# Altium schematic sheet ProjectSchematic.remote-reference.SchDoc
size A
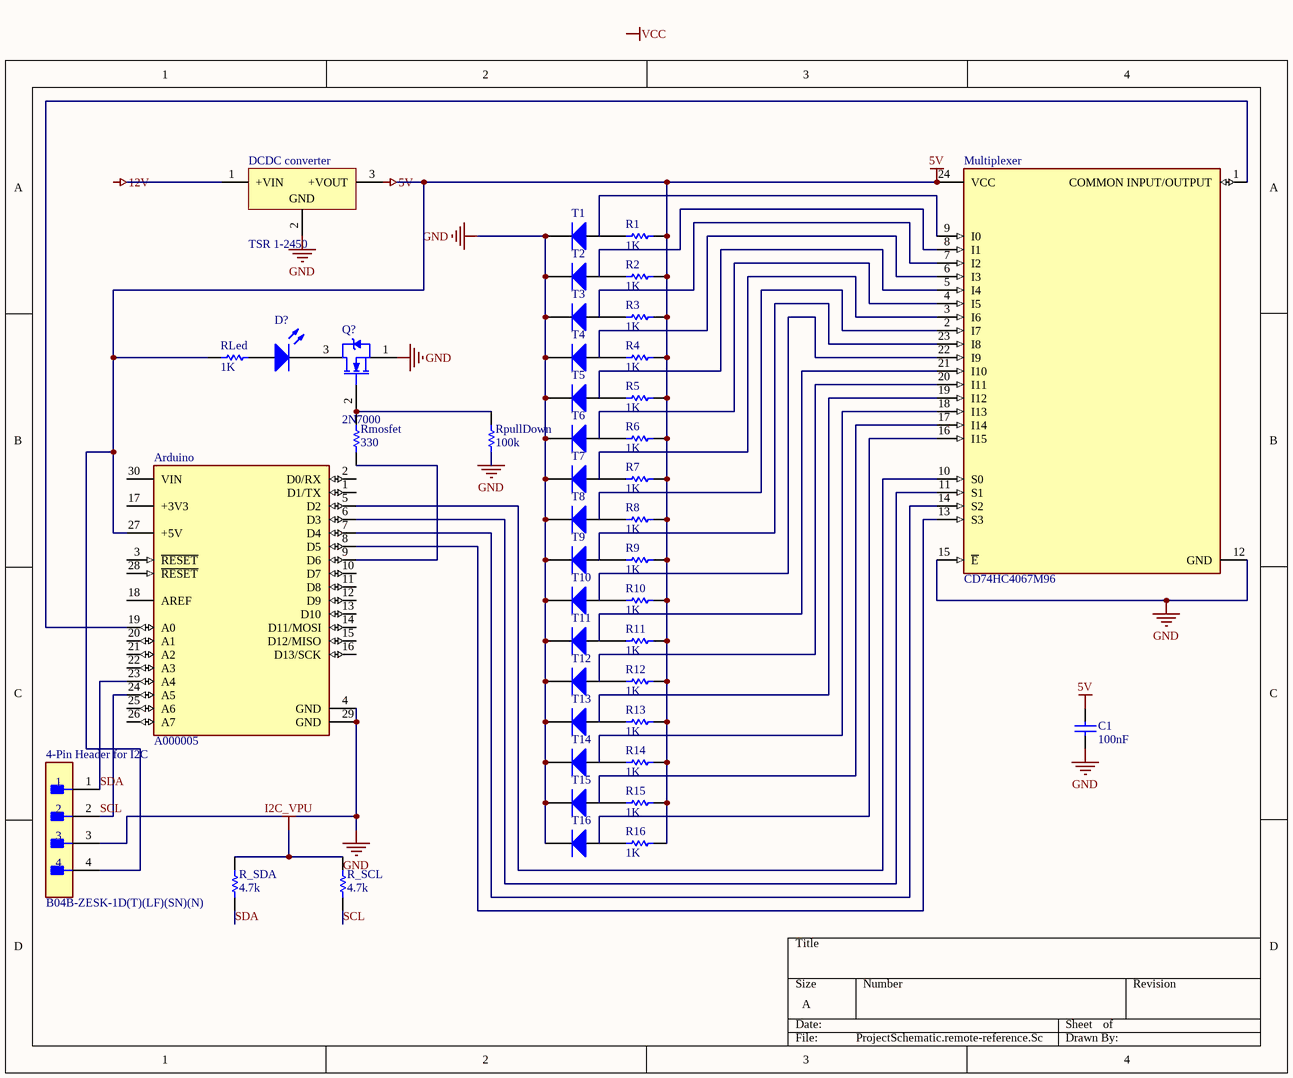
[diagram p0: ProjectSchematic.remote-reference.SchDoc]

## Parts
4-Pin_Header_for_I2C  B04B-ZESK-1D(T)(LF)(SN)(N)  [FP-B04B-ZESK-1D_T_LF_SN-MFG]
Arduino  A000005  [FP-A000005-MFG]
C1  value 100nF  (hidden comment: Capacitor)
D?  Light-Emitting Diode  (value not drawn)
DCDC_converter  TSR 1-2450  [TRACO-SIP-3_V]
Multiplexer  CD74HC4067M96  [FP-DW0024A-MFG]
Q?  2N7000  [ONSC-TO-92-3-29-11]
R1  value 1K  (hidden comment: Resistor)
R2  value 1K  (hidden comment: Resistor)
R3  value 1K  (hidden comment: Resistor)
R4  value 1K  (hidden comment: Resistor)
R5  value 1K  (hidden comment: Resistor)
R6  value 1K  (hidden comment: Resistor)
R7  value 1K  (hidden comment: Resistor)
R8  value 1K  (hidden comment: Resistor)
R9  value 1K  (hidden comment: Resistor)
R10  value 1K  (hidden comment: Resistor)
R11  value 1K  (hidden comment: Resistor)
R12  value 1K  (hidden comment: Resistor)
R13  value 1K  (hidden comment: Resistor)
R14  value 1K  (hidden comment: Resistor)
R15  value 1K  (hidden comment: Resistor)
R16  value 1K  (hidden comment: Resistor)
R_SCL  value 4.7k  (hidden comment: Resistor)
R_SDA  value 4.7k  (hidden comment: Resistor)
RLed  value 1K  (hidden comment: Resistor)
Rmosfet  value 330  (hidden comment: Resistor)
RpullDown  value 100k  (hidden comment: Resistor)
T1  Diode  (value not drawn)
T2  Diode  (value not drawn)
T3  Diode  (value not drawn)
T4  Diode  (value not drawn)
T5  Diode  (value not drawn)
T6  Diode  (value not drawn)
T7  Diode  (value not drawn)
T8  Diode  (value not drawn)
T9  Diode  (value not drawn)
T10  Diode  (value not drawn)
T11  Diode  (value not drawn)
T12  Diode  (value not drawn)
T13  Diode  (value not drawn)
T14  Diode  (value not drawn)
T15  Diode  (value not drawn)
T16  Diode  (value not drawn)

## Nets
5V: 4-Pin_Header_for_I2C.4 Arduino.27(+5V) C1.2 DCDC_converter.3(+VOUT) Multiplexer.24(VCC) R1.2 R2.2 R3.2 R4.2 R5.2 R6.2 R7.2 R8.2 R9.2 R10.2 R11.2 R12.2 R13.2 R14.2 R15.2 R16.2 RLed.1
GND: 4-Pin_Header_for_I2C.3 Arduino.4(GND) Arduino.29(GND) C1.1 DCDC_converter.2(GND) Multiplexer.12(GND) Multiplexer.15(~{E}) Q?.1(S) RpullDown.1 T1.2(K) T2.2(K) T3.2(K) T4.2(K) T5.2(K) T6.2(K) T7.2(K) T8.2(K) T9.2(K) T10.2(K) T11.2(K) T12.2(K) T13.2(K) T14.2(K) T15.2(K) T16.2(K)
I2C_VPU: R_SCL.2 R_SDA.2
SCL: 4-Pin_Header_for_I2C.2 Arduino.24(A5) R_SCL.1
SDA: 4-Pin_Header_for_I2C.1 Arduino.23(A4) R_SDA.1
NetArduino_5: Arduino.5(D2) Multiplexer.10(S0)
NetArduino_6: Arduino.6(D3) Multiplexer.11(S1)
NetArduino_7: Arduino.7(D4) Multiplexer.14(S2)
NetArduino_8: Arduino.8(D5) Multiplexer.13(S3)
NetArduino_9: Arduino.9(D6) Rmosfet.1
NetArduino_19: Arduino.19(A0) Multiplexer.1(COMMON_INPUT/OUTPUT)
NetD?_2: D?.2(K) Q?.3(D)
NetQ?_2: Q?.2(G) Rmosfet.2 RpullDown.2
NetR1_1: R1.1 T1.1(A)
NetR2_1: R2.1 T2.1(A)
NetR3_1: R3.1 T3.1(A)
NetR4_1: R4.1 T4.1(A)
NetR5_1: R5.1 T5.1(A)
NetR6_1: R6.1 T6.1(A)
NetR7_1: R7.1 T7.1(A)
NetR8_1: R8.1 T8.1(A)
NetR9_1: R9.1 T9.1(A)
NetR10_1: R10.1 T10.1(A)
NetR11_1: R11.1 T11.1(A)
NetR12_1: R12.1 T12.1(A)
NetR13_1: R13.1 T13.1(A)
NetR14_1: R14.1 T14.1(A)
NetR15_1: R15.1 T15.1(A)
NetR16_1: R16.1 T16.1(A)

Not connected (* = marked no-connect by the designer): Arduino 1(D1/TX) 2(D0/RX) 3(~{RESET}) 10(D7) 11(D8) 12(D9) 13(D10) 14(D11/MOSI) 15(D12/MISO) 16(D13/SCK) 17(+3V3) 18(AREF) 20(A1) 21(A2) 22(A3) 25(A6) 26(A7) 28(~{RESET}) 30(VIN); D? 1(A); DCDC_converter 1(+VIN); Multiplexer 2(I7) 3(I6) 4(I5) 5(I4) 6(I3) 7(I2) 8(I1) 9(I0) 16(I15) 17(I14) 18(I13) 19(I12) 20(I11) 21(I10) 22(I9) 23(I8); RLed 2

## Notes on the sheet
- Labels drawn without touching a wire or pin: 12V, VCC

## Library data of the parts
4-Pin_Header_for_I2C = CMP-17439-000625-1: CONN HEADER VERT 4POS 1.5MM; Pitch: 0.059inch; Number of Positions: 4; Gender: Male; Voltage Rating: 100V; Connector Type: Header; Packaging: Tray; Insulation Color: Natural; Min Operating Temperature: -25°C; Package Quantity: 1664; Contact Material: Copper Alloy; Contact Finish - Mating: TIN; Flammability Rating: UL94 V-0; Contact Shape: Rectangular; Termination: Kinked Pin; Number of Rows: 1; Insulation Material: Nylon; Contact Type: Outer Shroud Contact; Mount: Through Hole; Color: Natural; Series: ZE; Contact Plating: Tin; Number of Contacts: 4; Fastening Type: Ramp; Max Operating Temperature: 85°C
Arduino = CMP-189986-000002-1: ARDUINO NANO ATMEGA328 EVAL BRD; Number of Bits: 8; Evaluation Kit: Yes; Operating Supply Voltage: 12V; Interface: I2C; Data Bus Width: 8b; Core Architecture: AVR; Packaging: Bulk; Length: 7inch; Package Quantity: 50; Width: 5inch; REACH SVHC: No SVHC; Weight: 0.358383oz; Series: AVR® ATmega; Height: 0.25inch
C1 = Capacitor: SimulationGenericComponent: True
D? = LED: AF: 1; BV: 0; BV_MAX: 1e99; EG: 1.11; FC: 0.5; IBV: 0.001; IS: 1e-14; MJSW: 0.33; NTUN: 30; TNOM: 27; XTI: 3; SimulationGenericComponent: True; CJO: 0; CJP: 0; CTA: 0; CTP: 0; FCS: 0.5; FV_MAX: 1e99; IKF: 0; IKR: 0; ISR: 1e-14; JSW: 0; JTUN: 0; JTUNSW: 0; KEG: 1; KF: 0; LEVEL: 1; N: 1; NBV: 1; NR: 1; NS: 1; PHP: 1; RS: 0; TCV: 0; TLEV: 0; TLEVC: 0; TM1: 0; TM2: 0; TPB: 0; TPHP: 0; TRS: 0; TRS2: 0; TT: 0; TTT1: 0; TTT2: 0; VJ: 1; XTITUN: 3
DCDC_converter = CMP-2000-05427-1: DC/DC converter, 5 VDC, 1000 mA, -40 to 85 degC, 3-Pin SIP, RoHS; Manufacturer: Tracopower; Output Voltage Nom.: 5V; Output Current Max: 1A; Product Range: TSR-1Series; DC / DC Converter Mounting: ThroughHole; Output Power Max: 5W; No. of Outputs: 1Output; Input Voltage DC Max: 36V; Approvals & Standards: IEC,UL; Input Voltage DC Min: 6.5V; DC / DC Converter Output Type: Fixed; Depth: 11.7mm; Package Reference: SIP-3; DC / DC Converter Type: SIP; Height: 10.2mm; Width: 7.6mm; Package Description: 3-Pin Single In-line Package, Body 11.7 x 7.6 mm, Pitch 2.54 mm; Manufacturer URL: http://www.tracopower.com/home; Datasheet Version: Jan-15; Datasheet URL: https://datasheet.ciiva.com/6815/tsr1-6815641.pdf
Multiplexer = CMP-04901-000007-1: IC MUX/DEMUX 1X16 24SOIC; Manufacturer: Texas Instruments; Standoff Height: 0.1mm; Logic Function Desc: Non-Inverting; Max Supply Voltage: 6V; Number Of Inputs: 16; Quiescent Current: 8uA; Number Of Circuits: 1; Propagation Delay: 6ns; Max Junction Temp: +150°C; Min Supply Voltage: 2V; ComponentLink2Description: Datasheet; Octopart: https://octopart.com/cd74hc4067m96-texas+instruments-722802; Ambient Temperature Range High: +125°C; Ipc Land Pattern Name: SOIC127P1030X265-24; Height: 2.65mm; Mouser Description: Multiplexer Switch ICs Hi-Spd CMOS 16Ch Anl Mltplxr/Demltplxr; Temperature Range Low: -55°C; Package: DW0024A; Temperature Range High: +125°C; Lead Free: Yes; ComponentLink2URL: http://www.ti.com/lit/ds/symlink/cd74hc4067.pdf; Manufacturer Part Number: CD74HC4067M96; RoHS: TRUE; Automotive: No; Device Class L1: Integrated Circuits (ICs); Digikey Description: IC MUX/DEMUX 1X16 24SOIC; Device Class L2: Logic ICs; Temperature: -55°C to +125°C; Device Class L3: Multiplexers; Category: IC; Ambient Temperature Range Low: -55°C; Number Of Outputs: 1
Q? = CMP-1058-00936-1: Small Signal MOSFET, 200 mA, 60 V, N-Channel, 3-Pin TO-92, Bulk Box; Manufacturer: On Semiconductor; Ciss Typ (pF): 60; VGS(th) Max (V): 3; Crss Typ (pF): 5; Channel Polarity: N Channel; VGS Max (V): 20; Configuration: Single; PD Max (W): 0.35; Coss Typ (pF): 25; ID Max (A): 0.2; PackageVersion: Rev. AM; ComponentLink3URL: http://www.onsemi.cn/pub_link/Collateral/2N6426-D.PDF; ComponentLink2URL: http://www.onsemi.com/pub_link/Collateral/2N7000-D.PDF; DatasheetVersion: Rev. 8; Mounting Technology: Through Hole; V(BR)DSS Min (V): 60; PartNumber: 2N7000; PackageDescription: 3-Pin Transistor Outline, Body 4.825 x 3.685 mm, Pitch 1.27 mm; ComponentLink2Description: Datasheet; ComponentLink1URL: http://www.onsemi.com/; PackageReference: TO-92-3-29-11_AM_SL; Packing: Bulk Box; ComponentLink1Description: Manufacturer URL; Package Type: TO-92; ComponentLink3Description: Package Specification
R1-R16 R_SCL R_SDA RLed Rmosfet RpullDown = Resistor: TC1: 0; SimulationGenericComponent: True; TC2: 0
T1-T16 = Diode: AF: 1; BV: 0; BV_MAX: 1e99; EG: 1.11; FC: 0.5; IBV: 0.001; ISR: 1e-14; MJSW: 0.33; NTUN: 30; TNOM: 27; XTI: 3; SimulationGenericComponent: True; CJO: 0; CJP: 0; CTA: 0; CTP: 0; FCS: 0.5; FV_MAX: 1e99; IKF: 0; IKR: 0; JSW: 0; JTUN: 0; JTUNSW: 0; KEG: 1; KF: 0; LEVEL: 1; N: 1; NBV: 1; NR: 1; NS: 1; PHP: 1; RS: 0; TCV: 0; TLEV: 0; TLEVC: 0; TM1: 0; TM2: 0; TPB: 0; TPHP: 0; TRS: 0; TRS2: 0; TT: 0; TTT1: 0; TTT2: 0; VJ: 1; XTITUN: 3; IS: 1e-14